# Altium schematic sheet Memory_Section.SchDoc
size A
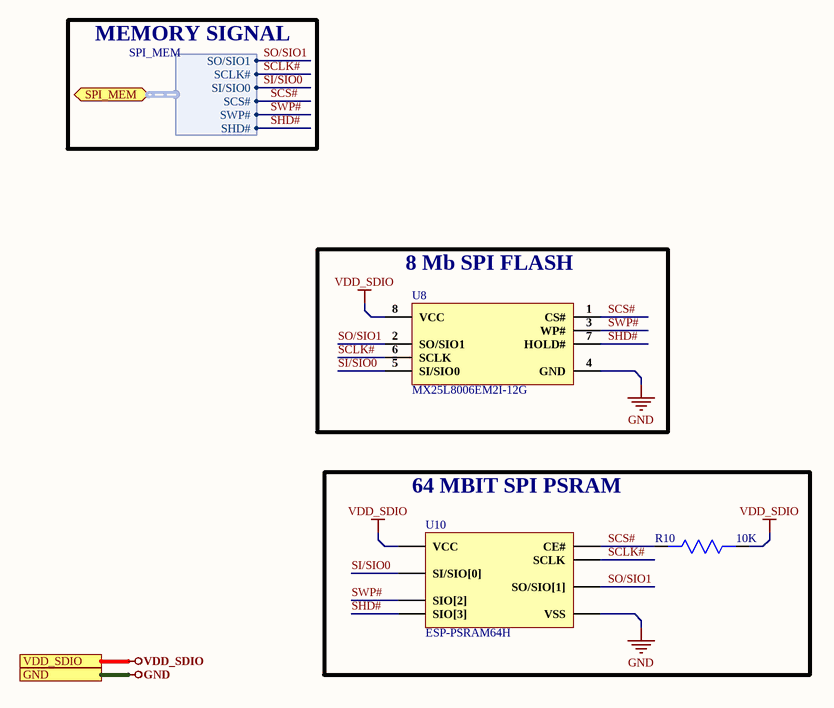
[diagram p0: Memory_Section.SchDoc]

## Parts
R10  10K  [Res0603]
U8  MX25L8006EM2I-12G  [SOP-8]
U10  ESP-PSRAM64H  [SOIC-8]

## Blocks framed on the sheet
8 Mb SPI FLASH: U8
64 MBIT SPI PSRAM: R10 U10

## Ports
GND, SPI_MEM (bidir, harness SPI_MEM), VDD_SDIO

## Harnesses
SPI_MEM: SO/SIO1, SCLK#, SI/SIO0, SCS#, SWP#, SHD#

## Nets
GND: U8.4(GND) U10.4(VSS) ; port GND
VDD_SDIO: R10.1 U8.8(VCC) U10.8(VCC) ; port VDD_SDIO
SCLK#: U8.6(SCLK) U10.6(SCLK) ; port SPI_MEM.SCLK#
SCS#: R10.2 U8.1(CS#) U10.1(CE#) ; port SPI_MEM.SCS#
SHD#: U8.7(HOLD#) U10.7(SIO[3]) ; port SPI_MEM.SHD#
SI/SIO0: U8.5(SI/SIO0) U10.5(SI/SIO[0]) ; port SPI_MEM.SI/SIO0
SO/SIO1: U8.2(SO/SIO1) U10.2(SO/SIO[1]) ; port SPI_MEM.SO/SIO1
SWP#: U8.3(WP#) U10.3(SIO[2]) ; port SPI_MEM.SWP#

## Notes on the sheet
- MEMORY SIGNAL

## Library data of the parts
R10 = RC0603FR-0710KL: RES SMD 10K OHM 1% 1/10W 0603; Manufacturer: Yageo; Resistance: 10kR; Temperature Coefficient: 100ppm/°C; Voltage Rating (DC): 50V; Power Rating: 100mW; Voltage Rating: 75V; Supplier 1: Digi-Key; Manufacturer Part Number: RC0603FR-0710KL; Stock 1: 144725424; Pricing 1: 1=0.1, 10=0.024, 100=0.0097, 1000=0.00437, 2500=0.00379 (USD); Case/Package: 0603; Number of Pins: 2; Weight: 7.1E-05oz; Case Code (Imperial): 0603; Case Code (Metric): 1608; Min Operating Temperature: -55°C; Max Operating Temperature: 155°C; Tolerance: 1%; Composition: Thick Film; Packaging: Tape and Reel; Military Standard: Not; Termination: SMD/SMT; Length: 1.6mm; Height: 0.45mm; Width: 0.8mm; Depth: 0.8mm; Lead Pitch: 0.3mm; REACH SVHC: No SVHC; Lead Free: Lead Free; ComponentLink1URL: http://www.farnell.com/datasheets/38590.pdf?src-supplier=Element14; ComponentLink1Description: http://www.farnell.com/datasheets/38590.pdf?src-supplier=Element14; ComponentLink2URL: https://www.verical.com/server-webapp/html/getDatasheet?partID=409289&src-supplier=Verical; ComponentLink2Description: https://www.verical.com/server-webapp/html/getDatasheet?partID=409289&src-supplier=Verical; ComponentLink3URL: http://www.farnell.com/datasheets/1868787.pdf?src-supplier=Element14; ComponentLink3Description: http://www.farnell.com/datasheets/1868787.pdf?src-supplier=Element14; ComponentLink4URL: http://www.farnell.com/datasheets/2167052.pdf?src-supplier=Element14; ComponentLink4Description: http://www.farnell.com/datasheets/2167052.pdf?src-supplier=Element14; ComponentLink5URL: http://www.farnell.com/datasheets/443971.pdf?src-supplier=Element14; ComponentLink5Description: http://www.farnell.com/datasheets/443971.pdf?src-supplier=Element14; Supplier Part Number 1: 311-10.0KHRDKR-ND
U8 = MX25L8006EM2I-12G: IC FLASH 8MBIT SPI 86MHZ 8SOP; Manufacturer: Macronix; Operating Supply Voltage: 3.6V; Density: 8Mb; Interface: SPI,Serial; Memory Type: Non-Volatile,FLASH; Supplier 1: Future Electronics; Manufacturer Part Number: MX25L8006EM2I-12G; RoHS: Yes; Category: Flash; Stock 1: 5568; Pricing 1: 1=0.54000, 75=0.47500, 250=0.46000, 750=0.44500, 2500=0.43000 (USD); Mount: Surface Mount; Case/Package: SOIC; Min Operating Temperature: -40°C; Max Operating Temperature: 85°C; Max Frequency: 86MHz; Packaging: Rail/Tube; Package Quantity: 98; Frequency: 86MHz; Memory Size: 8Mb; Series: MX25xxx05/06; Supply Voltage-Nom: 3.6V; Lead Free: Lead Free; Temperature Grade: INDUSTRIAL; RoHS Compliant: Yes; ComponentLink1URL: http://ckassoc.com/oldsite/pdf/Macronix_Product_Line_Card_July_2017_General%20_070617.pdf?src-supplier=Digi-Key; ComponentLink1Description: http://ckassoc.com/oldsite/pdf/Macronix_Product_Line_Card_July_2017_General%20_070617.pdf?src-supplier=Digi-Key; ComponentLink2URL: http://www.macronix.com/Lists/DataSheet/Attachments/1610/MX25L8006E,%203V,%208Mb,%20v1.4.pdf?src-supplier=Future+Electronics; ComponentLink2Description: http://www.macronix.com/Lists/DataSheet/Attachments/1610/MX25L8006E,%203V,%208Mb,%20v1.4.pdf?src-supplier=Future+Electronics; Supplier Part Number 1: 1123114
U10 = 4677: IC PSRAM 64MBIT SPI 133MHZ 8SOIC; Manufacturer: Adafruit Industries; Supplier 1: Newark; Manufacturer Part Number: 4677; RoHS: No; Category: Memory; Pricing 1: 1=1.75000 (USD); Supplier Part Number 1: 83AH9315